# Altium schematic sheet Buck-Boost-Sheet.SchDoc (part 1 of 2)
size A4; SheetNumber: 4; SheetTotal: 6
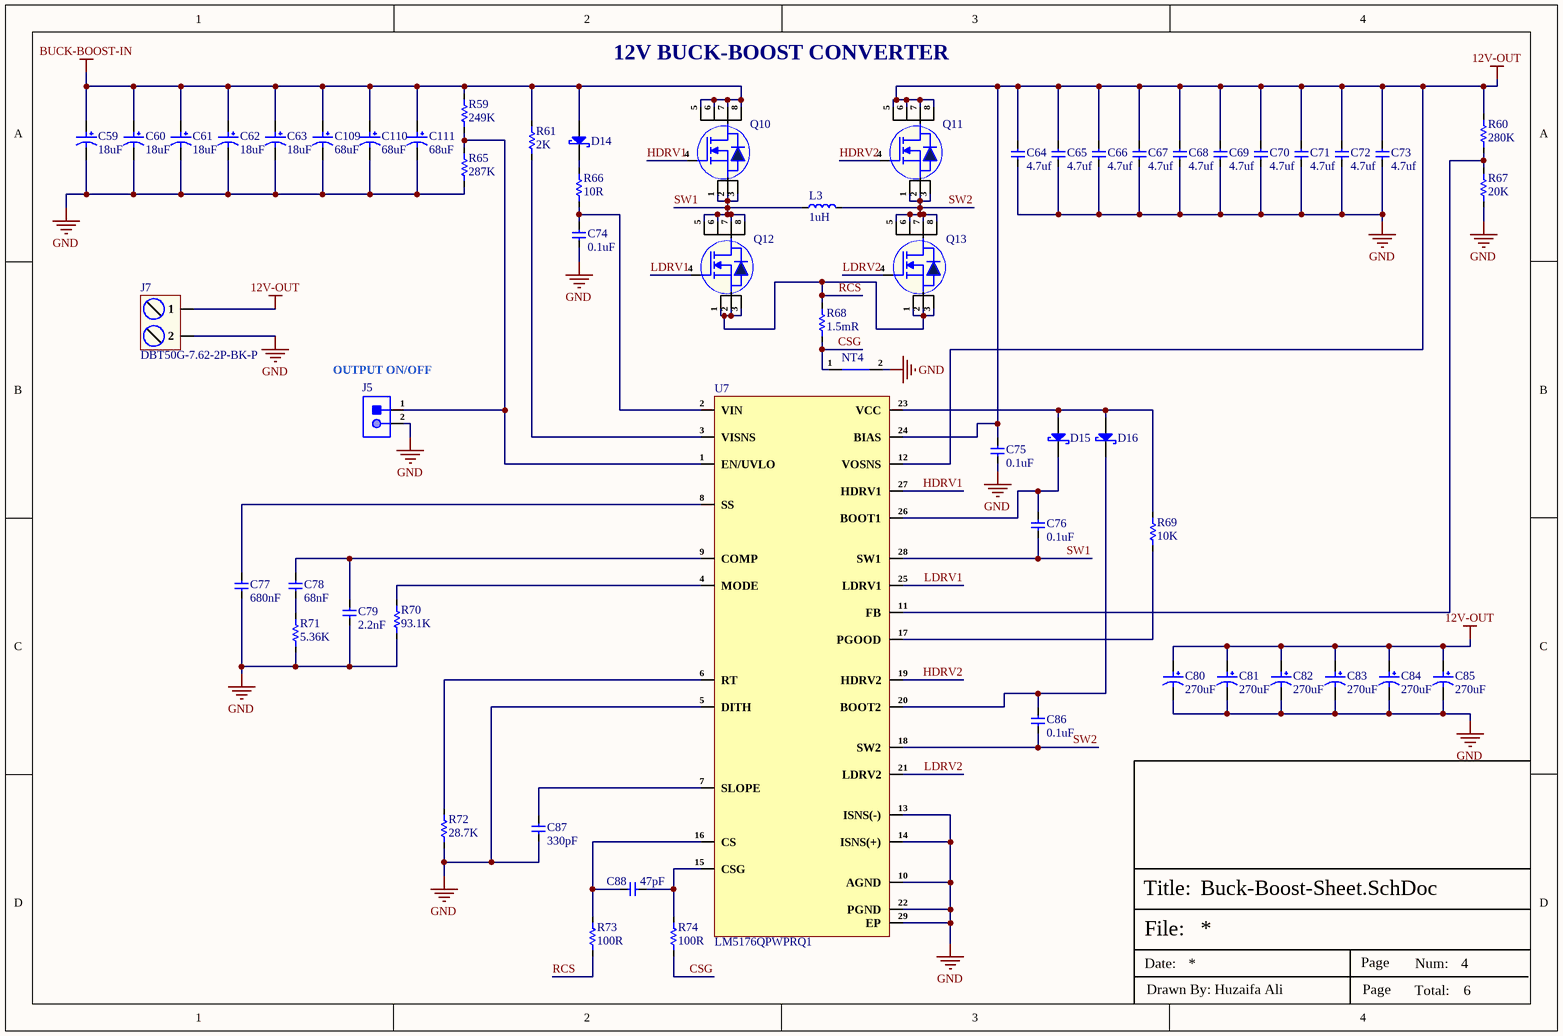
[diagram p0: Buck-Boost-Sheet.SchDoc]

## Parts
C59  18uF  [50SVPF18M]
C60  18uF  [50SVPF18M]
C61  18uF  [50SVPF18M]
C62  18uF  [50SVPF18M]
C63  18uF  [50SVPF18M]
C64  4.7uf  [Cap-0805]
C65  4.7uf  [Cap-0805]
C66  4.7uf  [Cap-0805]
C67  4.7uf  [Cap-0805]
C68  4.7uf  [Cap-0805]
C69  4.7uf  [Cap-0805]
C70  4.7uf  [Cap-0805]
C71  4.7uf  [Cap-0805]
C72  4.7uf  [Cap-0805]
C73  4.7uf  [Cap-0805]
C74  0.1uF  [CAP-0603]
C75  0.1uF  [CAP-0603]
C76  0.1uF  [CAP-0603]
C77  680nF  [Cap-1206]
C78  68nF  [Cap-0603]
C79  2.2nF  [Cap-0603]
C80  270uF  [16SVPG270M]
C81  270uF  [16SVPG270M]
C82  270uF  [16SVPG270M]
C83  270uF  [16SVPG270M]
C84  270uF  [16SVPG270M]
C85  270uF  [16SVPG270M]
C86  0.1uF  [CAP-0603]
C87  330pF  [Cap-0603]
C88  47pF  [Cap-0603]
C109  68uF  [50SVPF68M]
C110  68uF  [50SVPF68M]
C111  68uF  [50SVPF68M]
D14  CDBUR0230L-HF  [SOD-523F]  (value not drawn)
D15  CDBUR0230L-HF  [SOD-523F]  (value not drawn)
D16  B0520W  [SOD-123F]  (value not drawn)
J5  B2B-XH-A(LF)(SN)  [B2B-XH-A(LF)(SN)_]  (value not drawn)
J7  DBT50G-7.62-2P-BK-P  [DBT50G-7.62-2P-BK-P]
L3  1uH  [FXL2213-1R0-M]
NT4  Net Tie_SMD  [Net Tie Pad]  (value not drawn)  (net tie, no BOM)
Q10  CSD18511Q5A  [8-VSONP (5x6)]  (value not drawn)
Q11  CSD19533Q5A  [8-VSONP (5x6)]  (value not drawn)
Q12  CSD18531Q5A  [8-VSONP (5x6)]  (value not drawn)
Q13  CSD19533Q5A  [8-VSONP (5x6)]  (value not drawn)
R59  249K  [Res-0402]
R60  280K  [Res-0603]
R61  2K  [Res-0402]
R65  287K  [Res-0402]
R66  10R  [Res-0603]
R67  20K  [Res-0603]
R68  1.5mR  [5931]
R69  10K  [Res-0603]
R70  93.1K  [Res-0603]
R71  5.36K  [Res-0603]
R72  28.7K  [Res-0201]
R73  100R  [Res-0603]
R74  100R  [Res-0603]
U7  LM5176QPWPRQ1  [HTSSOP-28-EP]

## Nets
12V-OUT: C64.2 C65.2 C66.2 C67.2 C68.2 C69.2 C70.2 C71.2 C72.2 C73.2 C75.2 C80.1 C81.1 C82.1 C83.1 C84.1 C85.1 J7.1 Q11.5(D) Q11.6(D) Q11.7(D) Q11.8(D) R60.2 U7.12(VOSNS) U7.24(BIAS)
BUCK-BOOST-IN: C59.1 C60.1 C61.1 C62.1 C63.1 C109.1 C110.1 C111.1 D14.1(A) Q10.5(D) Q10.6(D) Q10.7(D) Q10.8(D) R59.2 R61.2
GND: C59.2 C60.2 C61.2 C62.2 C63.2 C64.1 C65.1 C66.1 C67.1 C68.1 C69.1 C70.1 C71.1 C72.1 C73.1 C74.1 C75.1 C77.1 C79.1 C80.2 C81.2 C82.2 C83.2 C84.2 C85.2 C87.1 C109.2 C110.2 C111.2 J5.2 J7.2 NT4.2 R65.1 R67.1 R70.1 R71.1 R72.1 U7.5(DITH) U7.10(AGND) U7.13(ISNS(-)) U7.14(ISNS(+)) U7.22(PGND) U7.29(EP)
CSG: NT4.1 R68.1 R74.1
HDRV1: Q10.4(G) U7.27(HDRV1)
HDRV2: Q11.4(G) U7.19(HDRV2)
LDRV1: Q12.4(G) U7.25(LDRV1)
LDRV2: Q13.4(G) U7.21(LDRV2)
RCS: Q12.1(S) Q12.2(S) Q12.3(S) Q13.1(S) Q13.2(S) Q13.3(S) R68.2 R73.1
SW1: C76.1 L3.1 Q10.1(S) Q10.2(S) Q10.3(S) Q12.5(D) Q12.6(D) Q12.7(D) Q12.8(D) U7.28(SW1)
SW2: C86.1 L3.2 Q11.1(S) Q11.2(S) Q11.3(S) Q13.5(D) Q13.6(D) Q13.7(D) Q13.8(D) U7.18(SW2)
NetC74_2: C74.2 R66.1 U7.2(VIN)
NetC76_2: C76.2 D15.2(K) U7.26(BOOT1)
NetC77_2: C77.2 U7.8(SS)
NetC78_1: C78.1 R71.2
NetC78_2: C78.2 C79.2 U7.9(COMP)
NetC86_2: C86.2 D16.1(K) U7.20(BOOT2)
NetC87_2: C87.2 U7.7(SLOPE)
NetC88_1: C88.1 R73.2 U7.16(CS)
NetC88_2: C88.2 R74.2 U7.15(CSG)
NetD14_2: D14.2(K) R66.2
NetD15_1: D15.1(A) D16.2(A) R69.2 U7.23(VCC)
NetJ5_1: J5.1 R59.1 R65.2 U7.1(EN/UVLO)
NetR60_1: R60.1 R67.2 U7.11(FB)
NetR61_1: R61.1 U7.3(VISNS)
NetR69_1: R69.1 U7.17(PGOOD)
NetR70_2: R70.2 U7.4(MODE)
NetR72_2: R72.2 U7.6(RT)

## Notes on the sheet
- 12V BUCK-BOOST CONVERTER
- (near J5) OUTPUT ON/OFF
- File:
- Title:
- Date:
- Page
- Num:
- Total:
- Drawn By: Huzaifa Ali